# Altium schematic sheet a0206-2006.6.SchDoc
size 558 x 431 mm
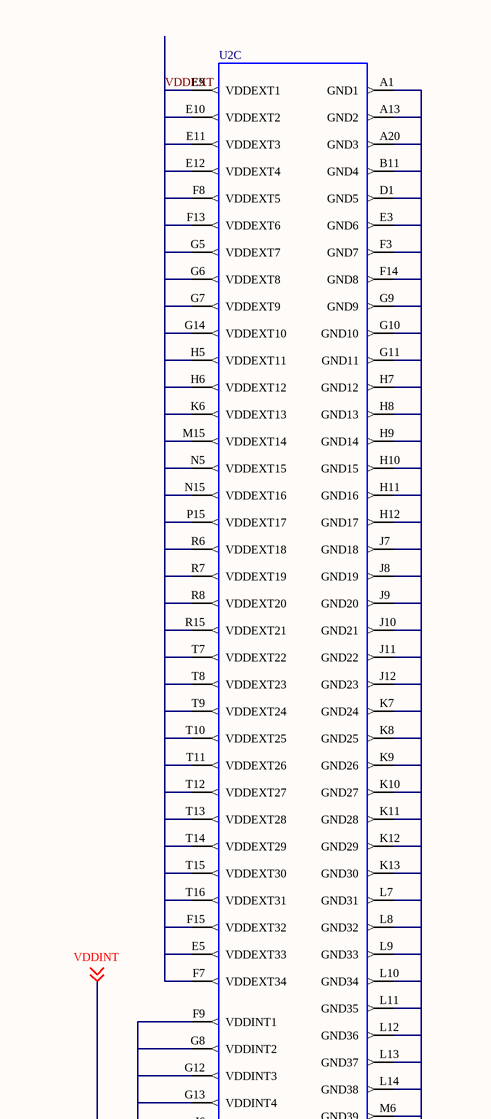
[diagram p0: a0206-2006.6.SchDoc, top left]
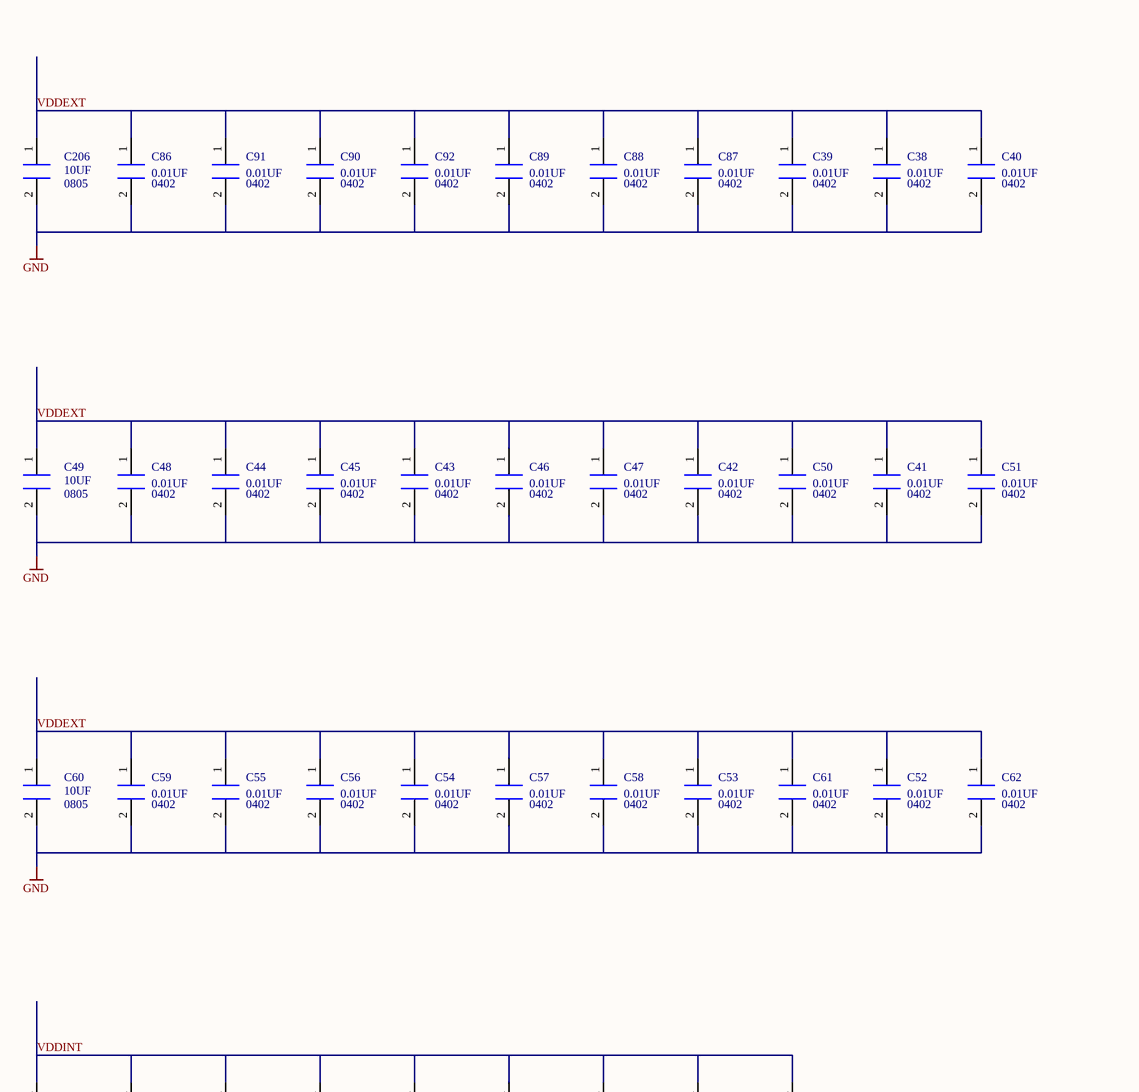
[diagram p1: a0206-2006.6.SchDoc, top right]
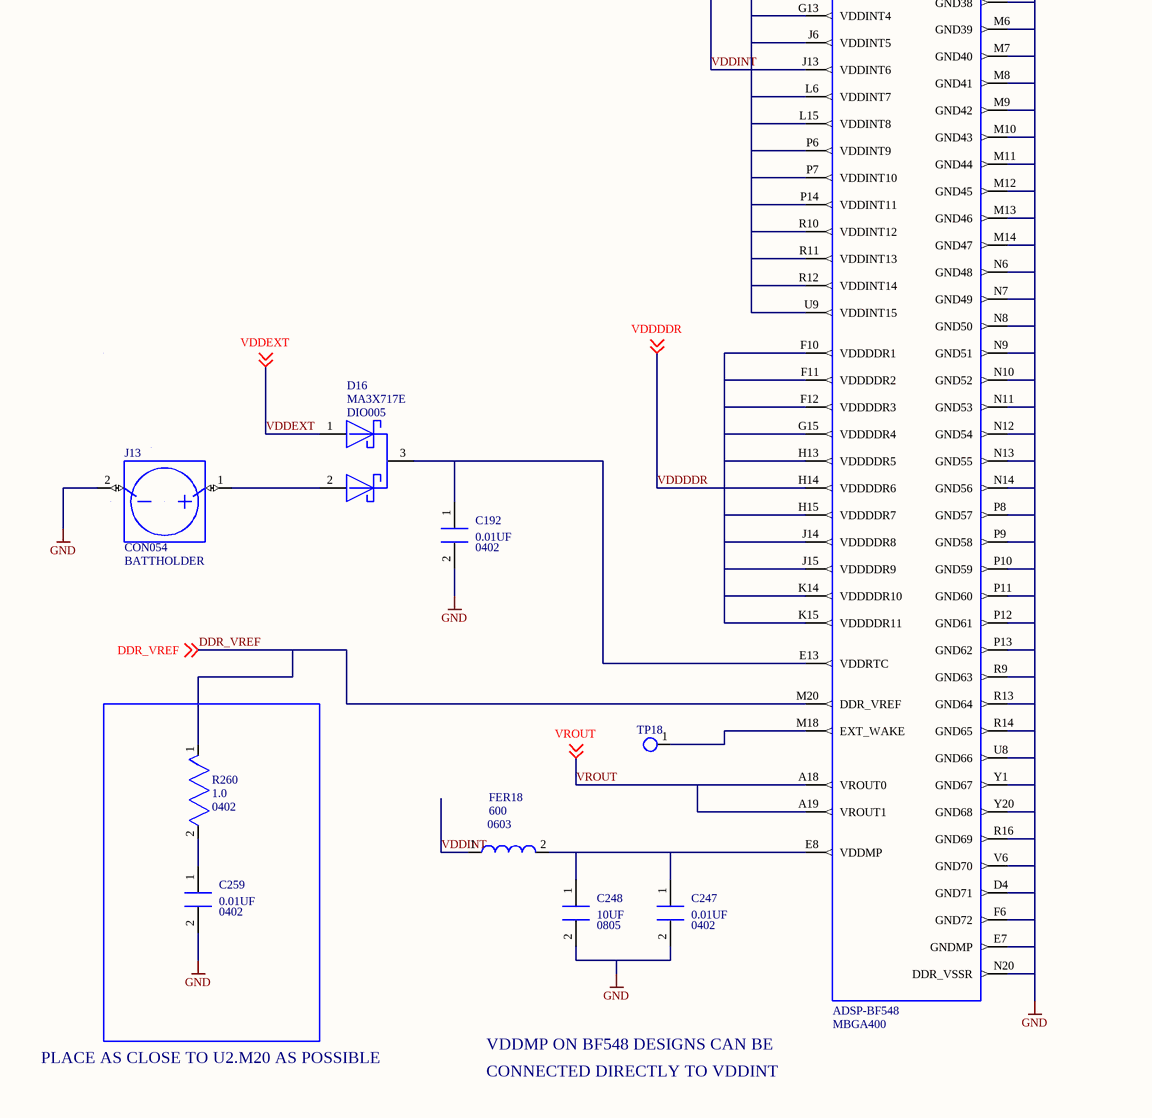
[diagram p2: a0206-2006.6.SchDoc, bottom left]
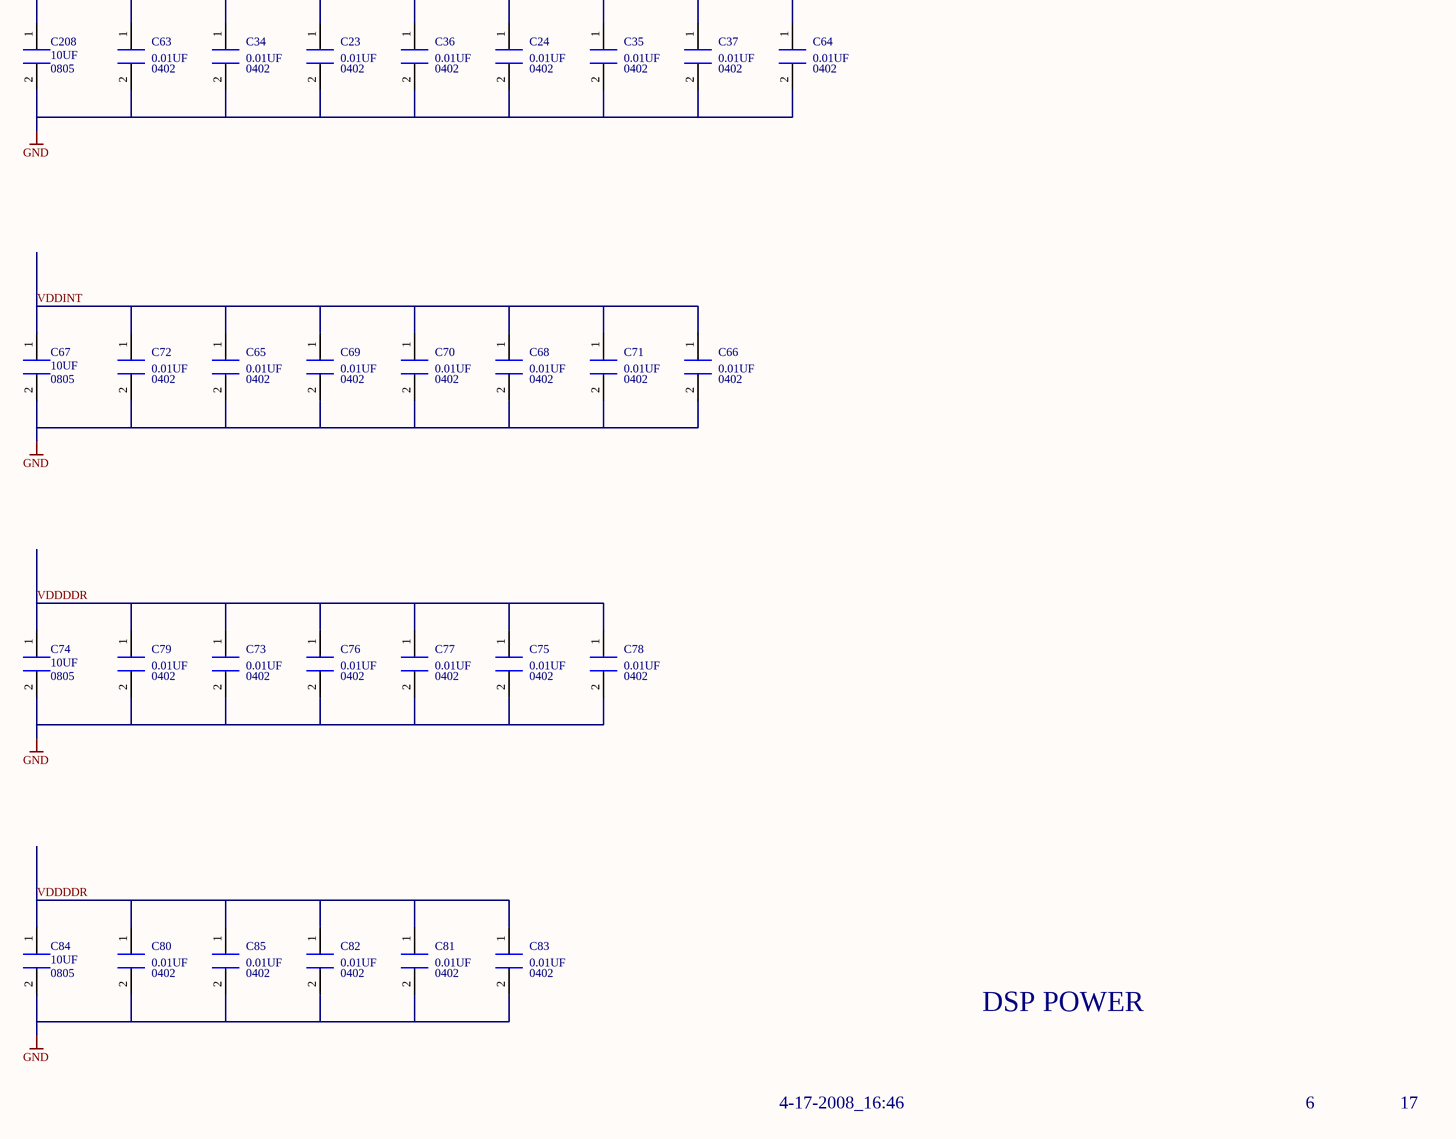
[diagram p3: a0206-2006.6.SchDoc, bottom right]

## Parts
C23  value 0.01UF  [0402]  (hidden comment: *)
C24  value 0.01UF  [0402]  (hidden comment: *)
C34  value 0.01UF  [0402]  (hidden comment: *)
C35  value 0.01UF  [0402]  (hidden comment: *)
C36  value 0.01UF  [0402]  (hidden comment: *)
C37  value 0.01UF  [0402]  (hidden comment: *)
C38  value 0.01UF  [0402]  (hidden comment: *)
C39  value 0.01UF  [0402]  (hidden comment: *)
C40  value 0.01UF  [0402]  (hidden comment: *)
C41  value 0.01UF  [0402]  (hidden comment: *)
C42  value 0.01UF  [0402]  (hidden comment: *)
C43  value 0.01UF  [0402]  (hidden comment: *)
C44  value 0.01UF  [0402]  (hidden comment: *)
C45  value 0.01UF  [0402]  (hidden comment: *)
C46  value 0.01UF  [0402]  (hidden comment: *)
C47  value 0.01UF  [0402]  (hidden comment: *)
C48  value 0.01UF  [0402]  (hidden comment: *)
C49  value 10UF  [0805]  (hidden comment: *)
C50  value 0.01UF  [0402]  (hidden comment: *)
C51  value 0.01UF  [0402]  (hidden comment: *)
C52  value 0.01UF  [0402]  (hidden comment: *)
C53  value 0.01UF  [0402]  (hidden comment: *)
C54  value 0.01UF  [0402]  (hidden comment: *)
C55  value 0.01UF  [0402]  (hidden comment: *)
C56  value 0.01UF  [0402]  (hidden comment: *)
C57  value 0.01UF  [0402]  (hidden comment: *)
C58  value 0.01UF  [0402]  (hidden comment: *)
C59  value 0.01UF  [0402]  (hidden comment: *)
C60  value 10UF  [0805]  (hidden comment: *)
C61  value 0.01UF  [0402]  (hidden comment: *)
C62  value 0.01UF  [0402]  (hidden comment: *)
C63  value 0.01UF  [0402]  (hidden comment: *)
C64  value 0.01UF  [0402]  (hidden comment: *)
C65  value 0.01UF  [0402]  (hidden comment: *)
C66  value 0.01UF  [0402]  (hidden comment: *)
C67  value 10UF  [0805]  (hidden comment: *)
C68  value 0.01UF  [0402]  (hidden comment: *)
C69  value 0.01UF  [0402]  (hidden comment: *)
C70  value 0.01UF  [0402]  (hidden comment: *)
C71  value 0.01UF  [0402]  (hidden comment: *)
C72  value 0.01UF  [0402]  (hidden comment: *)
C73  value 0.01UF  [0402]  (hidden comment: *)
C74  value 10UF  [0805]  (hidden comment: *)
C75  value 0.01UF  [0402]  (hidden comment: *)
C76  value 0.01UF  [0402]  (hidden comment: *)
C77  value 0.01UF  [0402]  (hidden comment: *)
C78  value 0.01UF  [0402]  (hidden comment: *)
C79  value 0.01UF  [0402]  (hidden comment: *)
C80  value 0.01UF  [0402]  (hidden comment: *)
C81  value 0.01UF  [0402]  (hidden comment: *)
C82  value 0.01UF  [0402]  (hidden comment: *)
C83  value 0.01UF  [0402]  (hidden comment: *)
C84  value 10UF  [0805]  (hidden comment: *)
C85  value 0.01UF  [0402]  (hidden comment: *)
C86  value 0.01UF  [0402]  (hidden comment: *)
C87  value 0.01UF  [0402]  (hidden comment: *)
C88  value 0.01UF  [0402]  (hidden comment: *)
C89  value 0.01UF  [0402]  (hidden comment: *)
C90  value 0.01UF  [0402]  (hidden comment: *)
C91  value 0.01UF  [0402]  (hidden comment: *)
C92  value 0.01UF  [0402]  (hidden comment: *)
C192  value 0.01UF  [0402]  (hidden comment: *)
C206  value 10UF  [0805]  (hidden comment: *)
C208  value 10UF  [0805]  (hidden comment: *)
C247  value 0.01UF  [0402]  (hidden comment: *)
C248  value 10UF  [0805]  (hidden comment: *)
C259  value 0.01UF  [0402]  (hidden comment: *)
D16  PART: MA3X717E  [DIO005]  (hidden comment: *)
FER18  value 600  [0603]  (hidden comment: *)
J13  BATTHOLDER  [CON054]
R260  value 1.0  [0402]  (hidden comment: *)
TP18  *  [TP]  (value not drawn)
U2  PART: ADSP-BF548  PKG_TYPE: MBGA400  (hidden comment: ICS_ADSPBF548)  (part C of 7)

## Nets
GND: C23.2(B) C24.2(B) C34.2(B) C35.2(B) C36.2(B) C37.2(B) C38.2(B) C39.2(B) C40.2(B) C41.2(B) C42.2(B) C43.2(B) C44.2(B) C45.2(B) C46.2(B) C47.2(B) C48.2(B) C49.2(B) C50.2(B) C51.2(B) C52.2(B) C53.2(B) C54.2(B) C55.2(B) C56.2(B) C57.2(B) C58.2(B) C59.2(B) C60.2(B) C61.2(B) C62.2(B) C63.2(B) C64.2(B) C65.2(B) C66.2(B) C67.2(B) C68.2(B) C69.2(B) C70.2(B) C71.2(B) C72.2(B) C73.2(B) C74.2(B) C75.2(B) C76.2(B) C77.2(B) C78.2(B) C79.2(B) C80.2(B) C81.2(B) C82.2(B) C83.2(B) C84.2(B) C85.2(B) C86.2(B) C87.2(B) C88.2(B) C89.2(B) C90.2(B) C91.2(B) C92.2(B) C192.2(B) C206.2(B) C208.2(B) C247.2(B) C248.2(B) C259.2(B) J13.2(NEG) U2.A1(GND1) U2.A13(GND2) U2.A20(GND3) U2.B11(GND4) U2.D1(GND5) U2.D4(GND71) U2.E3(GND6) U2.E7(GNDMP) U2.F3(GND7) U2.F6(GND72) U2.F14(GND8) U2.G9(GND9) U2.G10(GND10) U2.G11(GND11) U2.H7(GND12) U2.H8(GND13) U2.H9(GND14) U2.H10(GND15) U2.H11(GND16) U2.H12(GND17) U2.J7(GND18) U2.J8(GND19) U2.J9(GND20) U2.J10(GND21) U2.J11(GND22) U2.J12(GND23) U2.K7(GND24) U2.K8(GND25) U2.K9(GND26) U2.K10(GND27) U2.K11(GND28) U2.K12(GND29) U2.K13(GND30) U2.L7(GND31) U2.L8(GND32) U2.L9(GND33) U2.L10(GND34) U2.L11(GND35) U2.L12(GND36) U2.L13(GND37) U2.L14(GND38) U2.M6(GND39) U2.M7(GND40) U2.M8(GND41) U2.M9(GND42) U2.M10(GND43) U2.M11(GND44) U2.M12(GND45) U2.M13(GND46) U2.M14(GND47) U2.N6(GND48) U2.N7(GND49) U2.N8(GND50) U2.N9(GND51) U2.N10(GND52) U2.N11(GND53) U2.N12(GND54) U2.N13(GND55) U2.N14(GND56) U2.N20(DDR_VSSR) U2.P8(GND57) U2.P9(GND58) U2.P10(GND59) U2.P11(GND60) U2.P12(GND61) U2.P13(GND62) U2.R9(GND63) U2.R13(GND64) U2.R14(GND65) U2.R16(GND69) U2.U8(GND66) U2.V6(GND70) U2.Y1(GND67) U2.Y20(GND68)
DDR_VREF: R260.1(N1) U2.M20(DDR_VREF) ; off-sheet DDR_VREF
VDDDDR: C73.1(A) C74.1(A) C75.1(A) C76.1(A) C77.1(A) C78.1(A) C79.1(A) C80.1(A) C81.1(A) C82.1(A) C83.1(A) C84.1(A) C85.1(A) U2.F10(VDDDDR1) U2.F11(VDDDDR2) U2.F12(VDDDDR3) U2.G15(VDDDDR4) U2.H13(VDDDDR5) U2.H14(VDDDDR6) U2.H15(VDDDDR7) U2.J14(VDDDDR8) U2.J15(VDDDDR9) U2.K14(VDDDDR10) U2.K15(VDDDDR11) ; off-sheet VDDDDR
VDDEXT: C38.1(A) C39.1(A) C40.1(A) C41.1(A) C42.1(A) C43.1(A) C44.1(A) C45.1(A) C46.1(A) C47.1(A) C48.1(A) C49.1(A) C50.1(A) C51.1(A) C52.1(A) C53.1(A) C54.1(A) C55.1(A) C56.1(A) C57.1(A) C58.1(A) C59.1(A) C60.1(A) C61.1(A) C62.1(A) C86.1(A) C87.1(A) C88.1(A) C89.1(A) C90.1(A) C91.1(A) C92.1(A) C206.1(A) D16.1 U2.E5(VDDEXT33) U2.E9(VDDEXT1) U2.E10(VDDEXT2) U2.E11(VDDEXT3) U2.E12(VDDEXT4) U2.F7(VDDEXT34) U2.F8(VDDEXT5) U2.F13(VDDEXT6) U2.F15(VDDEXT32) U2.G5(VDDEXT7) U2.G6(VDDEXT8) U2.G7(VDDEXT9) U2.G14(VDDEXT10) U2.H5(VDDEXT11) U2.H6(VDDEXT12) U2.K6(VDDEXT13) U2.M15(VDDEXT14) U2.N5(VDDEXT15) U2.N15(VDDEXT16) U2.P15(VDDEXT17) U2.R6(VDDEXT18) U2.R7(VDDEXT19) U2.R8(VDDEXT20) U2.R15(VDDEXT21) U2.T7(VDDEXT22) U2.T8(VDDEXT23) U2.T9(VDDEXT24) U2.T10(VDDEXT25) U2.T11(VDDEXT26) U2.T12(VDDEXT27) U2.T13(VDDEXT28) U2.T14(VDDEXT29) U2.T15(VDDEXT30) U2.T16(VDDEXT31) ; off-sheet VDDEXT
VDDINT: C23.1(A) C24.1(A) C34.1(A) C35.1(A) C36.1(A) C37.1(A) C63.1(A) C64.1(A) C65.1(A) C66.1(A) C67.1(A) C68.1(A) C69.1(A) C70.1(A) C71.1(A) C72.1(A) C208.1(A) FER18.1(A) U2.F9(VDDINT1) U2.G8(VDDINT2) U2.G12(VDDINT3) U2.G13(VDDINT4) U2.J6(VDDINT5) U2.J13(VDDINT6) U2.L6(VDDINT7) U2.L15(VDDINT8) U2.P6(VDDINT9) U2.P7(VDDINT10) U2.P14(VDDINT11) U2.R10(VDDINT12) U2.R11(VDDINT13) U2.R12(VDDINT14) U2.U9(VDDINT15) ; off-sheet VDDINT
VROUT: U2.A18(VROUT0) U2.A19(VROUT1) ; off-sheet VROUT
NetC192_1: C192.1(A) D16.3 U2.E13(VDDRTC)
NetC247_1: C247.1(A) C248.1(A) FER18.2(B) U2.E8(VDDMP)
NetC259_1: C259.1(A) R260.2(N2)
NetD16_2: D16.2 J13.1(POS)
NetTP18_1: TP18.1(TP) U2.M18(EXT_WAKE)

## Notes on the sheet
- DSP POWER
- PLACE AS CLOSE TO U2.M20 AS POSSIBLE
- CONNECTED DIRECTLY TO VDDINT
- VDDMP ON BF548 DESIGNS CAN BE
- 4-17-2008_16:46
- 6
- 17
- A
- B
- C
- D
- 1
- 2
- 3
- 20 Cotton Road
- 4
- DEVICES
- ANALOG
- Nashua, NH 03063
- PH: 1-800-ANALOGD
- Title
- ADSP-BF548 EZ-KIT LITE
- Size
- Board No.
- A0206-2006
- Rev
- 1.4B
- Date
- Sheet
- of

## Library data of the parts
C23 C24 C34 C37 C50 C54 C55 C58 C59 C72 C79 C82 C83 C85 C86 C88 C91 C92 C192 C247 = CAP_NON_POLARIZED.2: PART_SPEC: CAPACITOR; LEVEL: STD; TYPE: X7R; BOARDS: BOTH; TOLERANCE: 10%; VOLTAGE: 16V; PRT_NUM: 7000279; PKG_TYPE: 0402; ROHS: ROHS
C35 C36 C40 C41 C53 C56 C57 C62 C81 C87 C89 C90 = CAP_NON_POLARIZED.2: PART_SPEC: CAPACITOR; LEVEL: STD; TYPE: X7R; BOARDS: BOTH; PRT_NUM: 7000279; VOLTAGE: 16V; TOLERANCE: 10%; PKG_TYPE: 0402; ROHS: ROHS
C38 C42 C45 C46 C51 C52 C70 C71 C77 C78 = CAP_NON_POLARIZED.2: PART_SPEC: CAPACITOR; LEVEL: STD; TOLERANCE: 10%; VOLTAGE: 16V; PRT_NUM: 7000279; BOARDS: BOTH; TYPE: X7R; PKG_TYPE: 0402; ROHS: ROHS
C39 C43 C44 C47 C48 C61 C63-C66 C68 C69 C73 C75 C76 C80 C259 = CAP_NON_POLARIZED.2: PART_SPEC: CAPACITOR; LEVEL: STD; PRT_NUM: 7000279; VOLTAGE: 16V; TOLERANCE: 10%; BOARDS: BOTH; TYPE: X7R; PKG_TYPE: 0402; ROHS: ROHS
C49 C67 C74 = CAP_NON_POLARIZED.2: PART_SPEC: CAPACITOR; LEVEL: STD; BOARDS: BOTH; TOLERANCE: 10%; VOLTAGE: 6.3V; PRT_NUM: 7000265; TYPE: X5R; PKG_TYPE: 0805; ROHS: ROHS
C60 C84 C206 C208 = CAP_NON_POLARIZED.2: PART_SPEC: CAPACITOR; LEVEL: STD; TYPE: X5R; PRT_NUM: 7000265; VOLTAGE: 6.3V; TOLERANCE: 10%; BOARDS: BOTH; PKG_TYPE: 0805; ROHS: ROHS
C248 = CAP_NON_POLARIZED.2: PART_SPEC: CAPACITOR; LEVEL: STD; PRT_NUM: 7000265; VOLTAGE: 6.3V; TOLERANCE: 10%; BOARDS: BOTH; TYPE: X5R; PKG_TYPE: 0805; ROHS: ROHS
D16 = DIO_MA3X717E.1: SCHOTTKY BARRIER; LEVEL: STD; CURRENT: 20MA; PRT_NUM: 7000559; PKG_TYPE: DIO005; WEB: http://www.semicon.panasonic.co.jp/ds/eng/SKH00078CED.pdf; ROHS: ROHS
FER18 = FER_STANDARD.1: PART_SPEC: FERRITE; LEVEL: STD; PRT_NUM: 7000112; FREQ: 100MHZ; CURRENT: 200MA; PKG_TYPE: 0603; ROHS: ROHS
J13 = CON_BATTERYHOLDER.1: FOR 24MM COIN; LEVEL: STD; PRT_NUM: 6000829; PKG_TYPE: CON054; DEVICE: BATTHOLDER; TYPE: BATT_HOLDER; CONFIGURATION: 24MM; ROHS: ROHS
R260 = RES_STANDARD.2: PART_SPEC: RESISTOR; LEVEL: STD; TOLERANCE: 1%; PRT_NUM: 7000608; POWER: 1/16W; PKG_TYPE: 0402; ROHS: ROHS
TP18 = MSC_TEST_POINT.2: TESTPOINT; CLASS: DNP; LEVEL: STD; PART_SPEC: TESTPOINT; PART: TESTPOINT; ROHS: ROHS; PKG_TYPE: TP
U2 = ICS_ADSPBF548_A: 600 MHZ; LEVEL: STD; PRT_NUM: 30-025548-02; DEVICE: ICS_ADSPBF548; ROHS: ROHS; WEB: http://www.analog.com/en/prod/0,2877,ADSP%252DBF548,00.html